# Altium schematic sheet Camera_Sheet.SchDoc
size A4; SheetNumber: 3; SheetTotal: 3
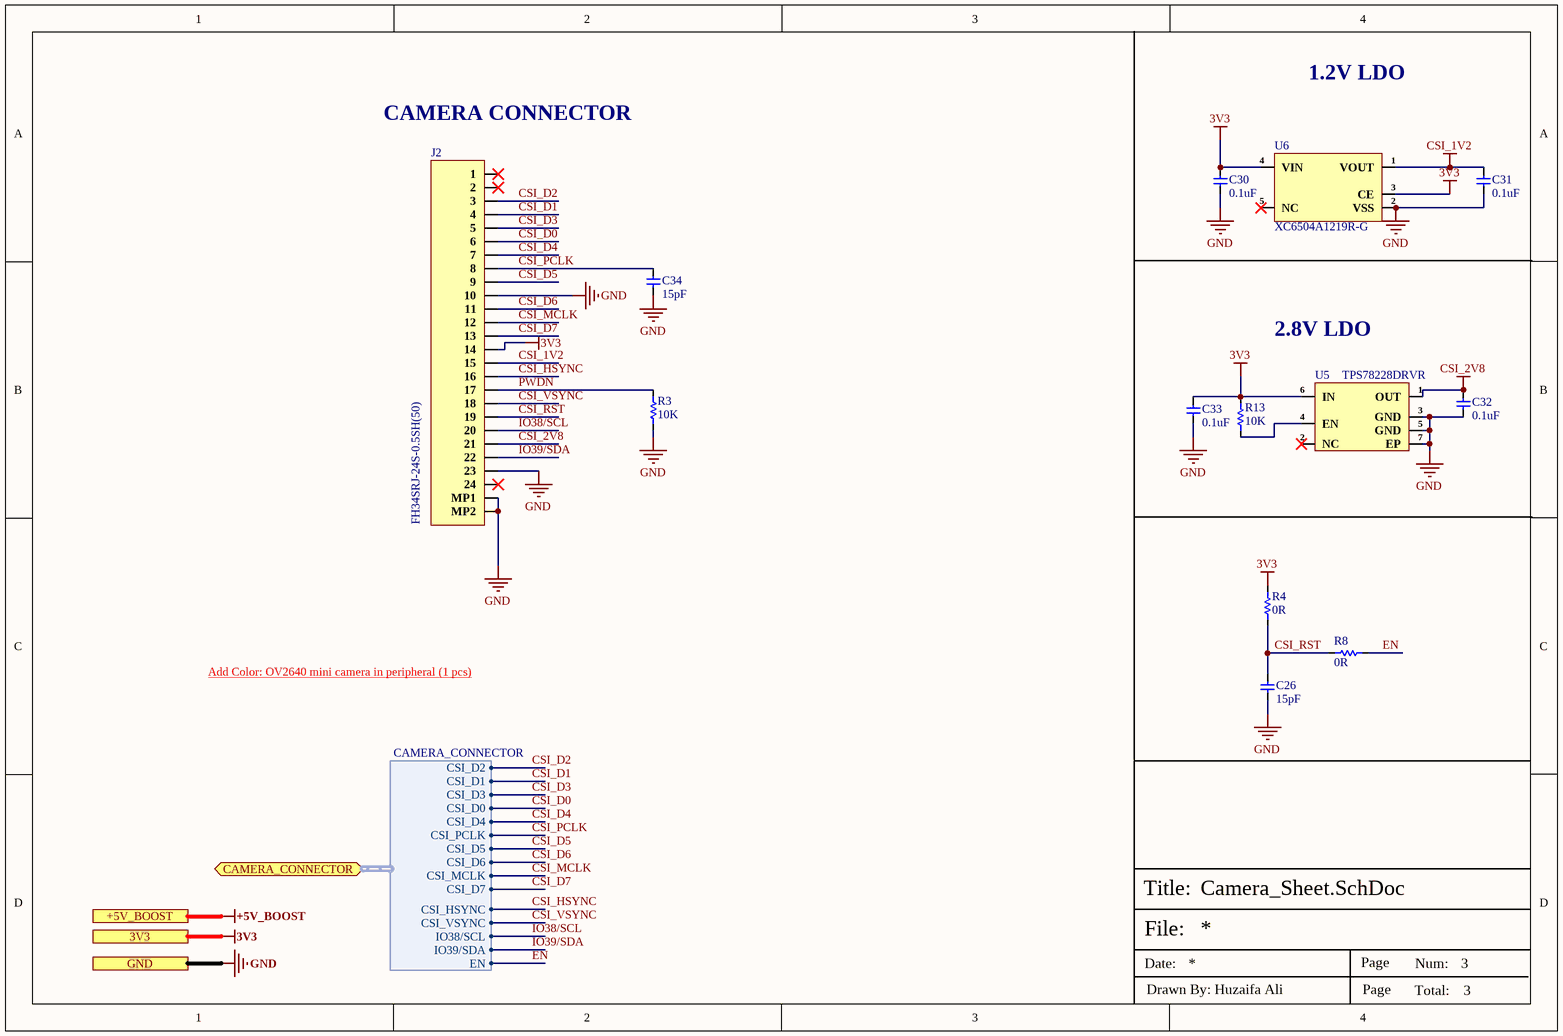
[diagram p0: Camera_Sheet.SchDoc]

## Parts
C26  15pF  [Cap-0402]
C30  0.1uF  [CAP-0201]
C31  0.1uF  [CAP-0201]
C32  0.1uF  [CAP-0201]
C33  0.1uF  [CAP-0201]
C34  15pF  [Cap-0201]
J2  FH34SRJ-24S-0.5SH(50)  [FH34SRJ-24S-0.5SH(50)]
R3  10K  [Res-0201]
R4  0R  [Res-0201]
R8  0R  [Res-0201]
R13  10K  [Res-0201]
U5  TPS78228DRVR  [6-WSON (2x2)]
U6  XC6504A1219R-G  [USPQ-4B04(1x1)]

## Ports
3V3, +5V_BOOST, CAMERA_CONNECTOR (bidir, harness CAMERA_CONNECTOR), GND

## Harnesses
CAMERA_CONNECTOR: CSI_D2, CSI_D1, CSI_D3, CSI_D0, CSI_D4, CSI_PCLK, CSI_D5, CSI_D6, CSI_MCLK, CSI_D7, CSI_HSYNC, CSI_VSYNC, IO38/SCL, IO39/SDA, EN

## Nets
3V3: C30.2 C33.2 J2.14 R4.2 R13.2 U5.6(IN) U6.3(CE) U6.4(VIN) ; port 3V3
+5V_BOOST: port +5V_BOOST
CSI_1V2: C31.2 J2.15 U6.1(VOUT)
CSI_2V8: C32.2 J2.21 U5.1(OUT)
GND: C26.1 C30.1 C31.1 C32.1 C33.1 C34.2 J2.10 J2.23 J2.MP1 J2.MP2 R3.2 U5.3(GND) U5.5(GND) U5.7(EP) U6.2(VSS) ; port GND
CSI_D0: J2.6 ; port CAMERA_CONNECTOR.CSI_D0
CSI_D1: J2.4 ; port CAMERA_CONNECTOR.CSI_D1
CSI_D2: J2.3 ; port CAMERA_CONNECTOR.CSI_D2
CSI_D3: J2.5 ; port CAMERA_CONNECTOR.CSI_D3
CSI_D4: J2.7 ; port CAMERA_CONNECTOR.CSI_D4
CSI_D5: J2.9 ; port CAMERA_CONNECTOR.CSI_D5
CSI_D6: J2.11 ; port CAMERA_CONNECTOR.CSI_D6
CSI_D7: J2.13 ; port CAMERA_CONNECTOR.CSI_D7
CSI_HSYNC: J2.16 ; port CAMERA_CONNECTOR.CSI_HSYNC
CSI_MCLK: J2.12 ; port CAMERA_CONNECTOR.CSI_MCLK
CSI_PCLK: C34.1 J2.8 ; port CAMERA_CONNECTOR.CSI_PCLK
CSI_RST: C26.2 J2.19 R4.1 R8.2
CSI_VSYNC: J2.18 ; port CAMERA_CONNECTOR.CSI_VSYNC
EN: R8.1 ; port CAMERA_CONNECTOR.EN
IO38/SCL: J2.20 ; port CAMERA_CONNECTOR.IO38/SCL
IO39/SDA: J2.22 ; port CAMERA_CONNECTOR.IO39/SDA
PWDN: J2.17 R3.1
NetR13_1: R13.1 U5.4(EN)

Not connected (* = marked no-connect by the designer): J2 1* 2* 24*; U5 2(NC)*; U6 5(NC)*

## Notes on the sheet
- 1.2V LDO
- (near J2) CAMERA CONNECTOR
- 2.8V LDO
- Add Color: OV2640 mini camera in peripheral (1 pcs) <https://vi.aliexpress.com/item/4001183891940.html?spm=a2g0o.productlist.main.15.30315addGOhk2D&algo_pvid=d0b0b3b8-6527-4c7f-b0c9-50cf0e267a3c&algo_exp_id=d0b0b3b8-6527-4c7f-b0c9-50cf0e267a3c-14&pdp_ext_f=%7B"order"%3A"23"%2C"eval"%3A"1"%7D&pdp_npi=4%40dis%21USD%219.23%218.12%21%21%219.23%218.12%21%40212e520f17534418093463223ebfd7%2110000015168877380%21sea%21PK%212520505835%21ABX&curPageLogUid=9l9RBMnPQLcD&utparam-url=scene%3Asearch%7Cquery_from%3A>
- File:
- Title:
- Date:
- Page
- Num:
- Total:
- Drawn By: Huzaifa Ali

## Library data of the parts
C26 = CQ0402GRNPO9BN150: CAP CER 15PF 50V C0G/NPO 0402; Manufacturer: Yageo; Item Type: Capacitors; Tolerance: 2%; Dielectric: C0G; Supplier: Digikey; LCSC Part Number: C577406; Manufacturer Part Number: CQ0402GRNPO9BN150; RoHS: Yes; Pricing: 10000=0.04366 (USD); Mounting Technology: Surface Mount; Case/Package: 0402; Case Code (Imperial): 0402; Case Code (Metric): 1005; Weight: 2.3E-05oz; Min Operating Temperature: -55°C; Max Operating Temperature: 125°C; Value: 15pF; Packaging: Tape and Reel; Voltage Rating: 50V; Voltage Rating (DC): 50V; Package Quantity: 10000; Series: CQ; ComponentLink1URL: http://www.mouser.com/ds/2/447/UPY-High%20Q_NP0_16V-to-250V_11-533944.pdf?src-supplier=Mouser; ComponentLink1Description: http://www.mouser.com/ds/2/447/UPY-High%20Q_NP0_16V-to-250V_11-533944.pdf?src-supplier=Mouser; ComponentLink2URL: http://www.yageo.com/documents/recent/UPY-High%20Q_NP0_16V-to-250V_13.pdf?src-supplier=Digikey; ComponentLink2Description: http://www.yageo.com/documents/recent/UPY-High%20Q_NP0_16V-to-250V_13.pdf?src-supplier=Digikey
C30-C33 = GRM033C81E104KE14D: CAP CER 0.1UF 25V X6S 0201; Manufacturer: Murata; Capacitance: 100nF; Tolerance: 10%; Supplier 1: Digi-Key; Manufacturer Part Number: GRM033C81E104KE14D; RoHS: Yes; Category: Ceramic Capacitors; Stock 1: 91; Pricing 1: 1=0.10000, 10=0.05100, 50=0.02780, 100=0.02260, 500=0.01616, 1000=0.01270, 2500=0.01155, 5000=0.01063 (USD); Mount: Surface Mount; Case/Package: 0201; Case Code (Metric): 0603; Case Code (Imperial): 0201; Weight: 1.2E-05oz; Min Operating Temperature: -55°C; Max Operating Temperature: 105°C; Packaging: Tape and Reel; Voltage Rating: 25V; Dielectric: X6S; Termination: SMD/SMT; Voltage Rating (DC): 25V; Package Quantity: 15000; Length: 0.024inch; Width: 0.3mm; Height: 0.3mm; Thickness: 0.013inch; RoHS Compliant: Yes; ComponentLink1URL: http://www.mouser.com/ds/2/281/c02e-2905.pdf?src-supplier=Mouser; ComponentLink1Description: http://www.mouser.com/ds/2/281/c02e-2905.pdf?src-supplier=Mouser; ComponentLink2URL: http://www.farnell.com/datasheets/2722733.pdf?src-supplier=Farnell; ComponentLink2Description: http://www.farnell.com/datasheets/2722733.pdf?src-supplier=Farnell; ComponentLink3URL: http://search.murata.co.jp/Ceramy/image/img/A01X/G101/ENG/GRM033C81E104KE14-01.pdf?src-supplier=Digi-Key; ComponentLink3Description: http://search.murata.co.jp/Ceramy/image/img/A01X/G101/ENG/GRM033C81E104KE14-01.pdf?src-supplier=Digi-Key; Supplier Part Number 1: 490-10403-1-ND
C34 = CC0201JRNPO9BN150: CAP CER 15PF 50V C0G/NPO 0201; Manufacturer: Yageo; Item Type: Capacitor; Supplier: Future Electronics; Supplier Part Number: 2580314; Manufacturer Part Number: CC0201JRNPO9BN150; RoHS: Yes; Category: Ceramic Capacitors; Stock: 585000; Pricing: 15000=0.0012, 60000=0.0011, 225000=0.0011, 600000=0.001, 1500000=0.001 (USD); ComponentLink1URL: https://datasheet.ciiva.com/176/mlccorderingcode-176501.pdf?src-supplier=Digi-Key; ComponentLink1Description: https://datasheet.ciiva.com/176/mlccorderingcode-176501.pdf?src-supplier=Digi-Key; ComponentLink2URL: https://datasheet.ciiva.com/176/mlccorderingcode-176502.pdf?src-supplier=Digi-Key; ComponentLink2Description: https://datasheet.ciiva.com/176/mlccorderingcode-176502.pdf?src-supplier=Digi-Key; ComponentLink3URL: https://datasheet.ciiva.com/176/mlccorderingcode-176503.pdf?src-supplier=Digi-Key; ComponentLink3Description: https://datasheet.ciiva.com/176/mlccorderingcode-176503.pdf?src-supplier=Digi-Key; ComponentLink4URL: https://datasheet.ciiva.com/17205/upy-gp-np0-16v-to-50v-8-17205625.pdf?src-supplier=Future+Electronics; ComponentLink4Description: https://datasheet.ciiva.com/17205/upy-gp-np0-16v-to-50v-8-17205625.pdf?src-supplier=Future+Electronics; LCSC Part Number: C277480
J2 = FH34SRJ-24S-0.5SH(50): CONN FPC/FFC 24POS .5MM; Manufacturer: Hirose; Supplier 1: Digi-Key; Manufacturer Part Number: FH34SRJ-24S-0.5SH(50); RoHS: Yes; Category: FFC / FPC; Stock 1: 5000; Pricing 1: 5000=0.53562 (USD); ComponentLink1URL: https://www.hirose.com/product/download/?distributor=digikey&amp;type=specSheet&amp;lang=en&amp;num=FH34SRJ-24S-0.5SH(50)&src-supplier=Digi-Key; ComponentLink1Description: https://www.hirose.com/product/download/?distributor=digikey&amp;type=specSheet&amp;lang=en&amp;num=FH34SRJ-24S-0.5SH(50)&src-supplier=Digi-Key; Supplier Part Number 1: FH34SRJ-24S-0.5SH(50)-ND; LCSC Part Number: C324726
R3 R13 = RC0201FR-0710KL: RES SMD 10K OHM 1% 1/20W 0201; Manufacturer: Yageo; Item Type: Resistor; Manufacturer Part Number: RC0201FR-0710KL; Package: 0201; ComponentLink7Description: LCSC; ComponentLink7URL: https://www.lcsc.com/product-detail/Chip-Resistor-Surface-Mount_YAGEO-RC0201FR-0710KL_C106225.html; LCSC Part Number: C106225
R4 R8 = RC0201JR-070RL: RES SMD 0 OHM JUMPER 1/20W 0201; Manufacturer: Yageo; Power Rating: 50mW; Tolerance: 5%; Voltage Rating: 25V; Supplier 1: Digi-Key; Manufacturer Part Number: RC0201JR-070RL; RoHS: Yes; Category: Chip SMD Resistors; Stock 1: 11079; Pricing 1: 1=0.10000, 10=0.03600, 25=0.02640, 50=0.02000, 100=0.01480, 250=0.01128, 500=0.00904, 1000=0.00665, 5000=0.00477 (USD); Case/Package: 0201; Contact Plating: Tin,Matte; Case Code (Metric): 0603; Case Code (Imperial): 0201; Weight: 6E-06oz; Size Code: 0201; Min Operating Temperature: -55°C; Max Operating Temperature: 125°C; Resistor Type: Thick Film; Resistance: 0R; Packaging: Tape and Reel; Package Quantity: 10000; Number of Terminations: 2; Termination: SMD/SMT; Max Power Dissipation: 50mW; Voltage Rating (DC): 25V; Features: Moisture Resistant; Series: RC; Construction: Rectangular; Resistance Tolerance: 5%; Length: 0.6mm; Width: 0.012inch; Height: 0.01inch; Depth: 0.3mm; Radiation Hardening: No; RoHS Compliant: Yes; REACH SVHC: Unknown; Military Standard: Not; Lead Free: Lead Free; ComponentLink1URL: https://datasheet.ciiva.com/7672/1563626-7672247.pdf?src-supplier=Element14; ComponentLink1Description: https://datasheet.ciiva.com/7672/1563626-7672247.pdf?src-supplier=Element14; ComponentLink2URL: https://datasheet.ciiva.com/7660/1421516-7660808.pdf?src-supplier=Element14; ComponentLink2Description: https://datasheet.ciiva.com/7660/1421516-7660808.pdf?src-supplier=Element14; ComponentLink3URL: https://datasheet.ciiva.com/7672/1563626-7672248.pdf?src-supplier=Element14; ComponentLink3Description: https://datasheet.ciiva.com/7672/1563626-7672248.pdf?src-supplier=Element14; ComponentLink4URL: https://datasheet.ciiva.com/16855/pyu-rc0201-51-rohs-l-8-16855994.pdf?src-supplier=Avnet+Europe; ComponentLink4Description: https://datasheet.ciiva.com/16855/pyu-rc0201-51-rohs-l-8-16855994.pdf?src-supplier=Avnet+Europe; ComponentLink5URL: https://datasheet.ciiva.com/28419/pyu-rc0201-51-rohs-l-8-28419660.pdf?src-supplier=Avnet+Europe; ComponentLink5Description: https://datasheet.ciiva.com/28419/pyu-rc0201-51-rohs-l-8-28419660.pdf?src-supplier=Avnet+Europe; ComponentLink6URL: https://datasheet.ciiva.com/46391/1421516-46391340.pdf?src-supplier=Element14; ComponentLink6Description: https://datasheet.ciiva.com/46391/1421516-46391340.pdf?src-supplier=Element14; ComponentLink7URL: https://datasheet.ciiva.com/8896/pyu-rc0201-51-rohs-l-8-8896143.pdf?src-supplier=Avnet; ComponentLink7Description: https://datasheet.ciiva.com/8896/pyu-rc0201-51-rohs-l-8-8896143.pdf?src-supplier=Avnet; Supplier Part Number 1: 311-0.0NCT-ND; LCSC Part Number: C106228
U5 = TPS78228DRVR: IC REG LINEAR 2.8V 150MA 6-WSON; Manufacturer: Texas Instruments; Supplier: Mouser; LCSC Part Number: C2876267; Manufacturer Part Number: TPS78228DRVR; RoHS: Yes; Item Type: IC; Stock: 2455; Pricing: 1=0.8, 10=0.574, 50=0.516, 100=0.453, 1000=0.39, 10000=0.303 (USD); ComponentLink1URL: https://datasheet.ciiva.com/41462/001015109-da-01-en-ic-reg-ldo-2-8v-tps78228drvr-wson-6-tid-41462955.pdf?src-supplier=Conrad; ComponentLink1Description: https://datasheet.ciiva.com/41462/001015109-da-01-en-ic-reg-ldo-2-8v-tps78228drvr-wson-6-tid-41462955.pdf?src-supplier=Conrad; ComponentLink2URL: https://datasheet.ciiva.com/2052/tps782-2052513.pdf?src-supplier=Digikey; ComponentLink2Description: https://datasheet.ciiva.com/2052/tps782-2052513.pdf?src-supplier=Digikey; ComponentLink3URL: https://datasheet.ciiva.com/2052/tps782-2052514.pdf?src-supplier=Digikey; ComponentLink3Description: https://datasheet.ciiva.com/2052/tps782-2052514.pdf?src-supplier=Digikey; ComponentLink4URL: https://datasheet.ciiva.com/2052/tps782-2052515.pdf?src-supplier=Digikey; ComponentLink4Description: https://datasheet.ciiva.com/2052/tps782-2052515.pdf?src-supplier=Digikey
U6 = XC6504A1219R-G: IC REG LIN 1.2V 150MA USPQ-4B04; Manufacturer: Torex; Supplier: Digikey; LCSC Part Number: C216662; Manufacturer Part Number: XC6504A1219R-G; RoHS: No; Item Type: IC; Stock: 3000; Pricing: 1=0.74, 10=0.456, 25=0.38, 100=0.2939, 250=0.25156, 500=0.22552, 1000=0.20381 (USD); ComponentLink1URL: https://www.torexsemi.com/file/xc6504/XC6504.pdf?src-supplier=Digikey; ComponentLink1Description: https://www.torexsemi.com/file/xc6504/XC6504.pdf?src-supplier=Digikey